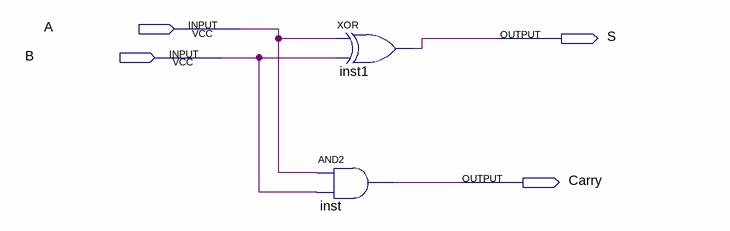
[diagram p0: schematic sheet]
// Quartus schematic HA.bdf as structural Verilog: 2 symbols, 4 pins
module HA (
  input  A,
  input  B,
  output S,
  output Carry
);

  xor inst1 (S, A, B);
  and inst (Carry, A, B);
endmodule
